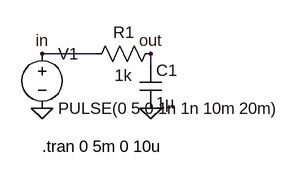
[diagram p0: schematic circuit.asc]
circuit.asc, the LTspice schematic file:
Version 4
SHEET 1 880 680
WIRE 0 16 80 16
WIRE 160 16 160 32
FLAG 0 96 0
FLAG 160 96 0
FLAG 0 16 in
FLAG 160 16 out
SYMBOL voltage 0 0 R0
WINDOW 123 0 0 Left 0
WINDOW 39 0 0 Left 0
SYMATTR InstName V1
SYMATTR Value PULSE(0 5 0 1n 1n 10m 20m)
SYMBOL res 64 32 R270
WINDOW 0 32 56 VTop 2
WINDOW 3 0 56 VBottom 2
SYMATTR InstName R1
SYMATTR Value 1k
SYMBOL cap 144 32 R0
SYMATTR InstName C1
SYMATTR Value 1µ
TEXT 0 152 Left 2 !.tran 0 5m 0 10u

The netlist it stands for:
* circuit.asc
V1 in 0 PULSE(0 5 0 1n 1n 10m 20m)
R1 in out 1k
C1 out 0 1µ
.tran 0 5m 0 10u
.backanno
.end